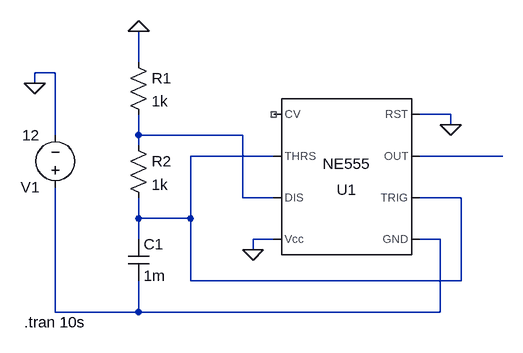
[diagram p0: schematic Draft1.asc]
Draft1.asc, the LTspice schematic file:
Version 4.1
SHEET 1 880 680
WIRE -272 -96 -272 -144
WIRE -400 -80 -432 -80
WIRE -432 -64 -432 -80
WIRE 208 -16 160 -16
WIRE 208 0 208 -16
WIRE -400 16 -400 -80
WIRE -272 16 -272 -16
WIRE -112 16 -272 16
WIRE -272 32 -272 16
WIRE -64 48 -192 48
WIRE 288 48 160 48
WIRE -112 112 -112 16
WIRE -64 112 -112 112
WIRE 224 112 160 112
WIRE -272 144 -272 112
WIRE -192 144 -192 48
WIRE -192 144 -272 144
WIRE -272 176 -272 144
WIRE -64 176 -96 176
WIRE 192 176 160 176
WIRE -96 192 -96 176
WIRE -192 240 -192 144
WIRE 224 240 224 112
WIRE 224 240 -192 240
WIRE -400 288 -400 96
WIRE -272 288 -272 240
WIRE -272 288 -400 288
WIRE 192 288 192 176
WIRE 192 288 -272 288
FLAG -432 -64 0
FLAG -96 192 0
FLAG -272 -144 0
FLAG 208 0 0
SYMBOL Misc\\NE555 48 80 R180
SYMATTR InstName U1
SYMBOL voltage -400 112 R180
WINDOW 123 0 0 Left 0
WINDOW 39 0 0 Left 0
SYMATTR InstName V1
SYMATTR Value 12
SYMBOL res -288 -112 R0
SYMATTR InstName R1
SYMATTR Value 1k
SYMBOL res -288 16 R0
SYMATTR InstName R2
SYMATTR Value 1k
SYMBOL cap -288 176 R0
SYMATTR InstName C1
SYMATTR Value 1m
TEXT -448 304 Left 2 !.tran 10s

The netlist it stands for:
* Draft1.asc
X§U1 N004 N002 N003 0 NC_01 N002 N001 0 NE555  ; pins GND TRIG OUT RST CV THRS DIS Vcc
V1 N004 0 12
R1 0 N001 1k
R2 N001 N002 1k
C1 N002 N004 1m
.tran 10s
.lib NE555.sub
.backanno
.end